# Altium schematic sheet Sheet2.SchDoc
size A; SheetNumber: 2; SheetTotal: 2
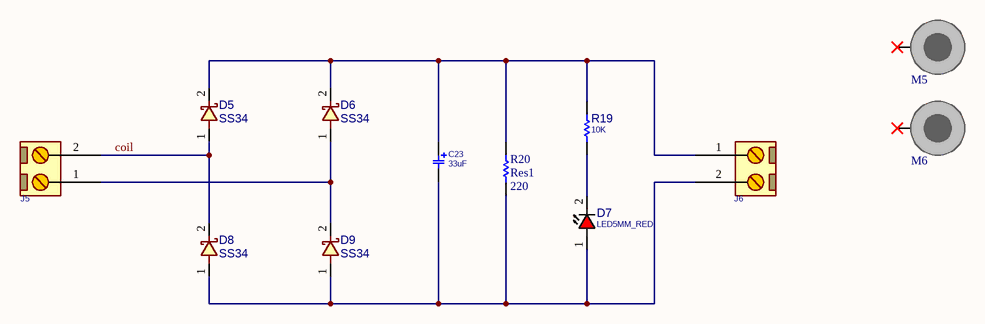
[diagram p0: Sheet2.SchDoc]

## Parts
C23  33uF  [C_TN_6032]
D5  SS34  [D_SMB]
D6  SS34  [D_SMB]
D7  LED5MM_RED  [LED5MM_RED]
D8  SS34  [D_SMB]
D9  SS34  [D_SMB]
J5  CONN_TB2  [MSTB_2]  (value not drawn)
J6  CONN_TB2  [MSTB_2]  (value not drawn)
M5  DNP/MH  [SCMH_M3]  (value not drawn)  (no BOM)
M6  DNP/MH  [SCMH_M3]  (value not drawn)  (no BOM)
R19  10K  [R1206]
R20  Res1  value 220  [AXIAL-0.3]

## Nets
coil: D5.1 D8.2 J5.2
NetC23_1: C23.1 D5.2 D6.2 J6.1 R19.2 R20.2
NetC23_2: C23.2 D7.1(ANODE) D8.1 D9.1 J6.2 R20.1
NetD6_1: D6.1 D9.2 J5.1
NetD7_2: D7.2(CATHODE) R19.1

Not connected (* = marked no-connect by the designer): M5 1*; M6 1*

## Library data of the parts
C23 = CAP_SMD_TAN_6032: CAP, SMD, TAN,; PARAM2: -V; VALUE: 33uF
D5 D6 D8 D9 = DIODE_SMD_SCHOTTKY_SS34: DIODE, SCHOTTKY, 40V, 3A; MANF: VISHAY; DESC: DESCRIPTION; PARAM: 20V; MANF_P#: SS34; ASSEMBLY: ASSEMBLY; PRICE: PRICE; PARAM2: 3A; VALUE: SS34
D7 = LED_THD_5MM_RED: LED, THD, 5MM, RED; DESC: DESCRIPTION; MANF_P#: MANF_PART#; PARAM2: 2.2V; MANF: MANF; ASSEMBLY: ASSEMBLY; PRICE: PRICE; VALUE: LED5MM_RED
J5 J6 = CONN_MSTB_2: CONN, PHOENIX MSTB, 5-G, 5.08mm pitch; PARAM2: 320V; PARAM: 12A; VALUE: CONN_TB2
M5 M6 = SCMH_M3: SCREW mouting, M3, 3.0mm diameter and 6.0mm PanHead; ASSEMBLY: DNP; VALUE: DNP/MH
R19 = RES_SMD_1206: RESISTOR, SMD; PARAM: -W; DESC: DESCRIPTION; DIST#: MOUSER; PARAM2: 1%; MANF_P#: -; MANF: -; ASSEMBLY: ASSEMBLY; PRICE: 100= 0.5$; VALUE: 10K
R20 = Res1: Resistor; Published: 8-Jun-2000; LatestRevisionDate: 17-Jul-2002; LatestRevisionNote: Re-released for DXP Platform.; PackageReference: AXIAL-0.3; Publisher: Altium Limited; PackageDescription: Axial Device, Thru-Hole; 2 Leads; 0.3 in Pin Spacing